# Altium project 24V-10A-Power-Board-v1.0.PrjPcb (part 13 of 17)
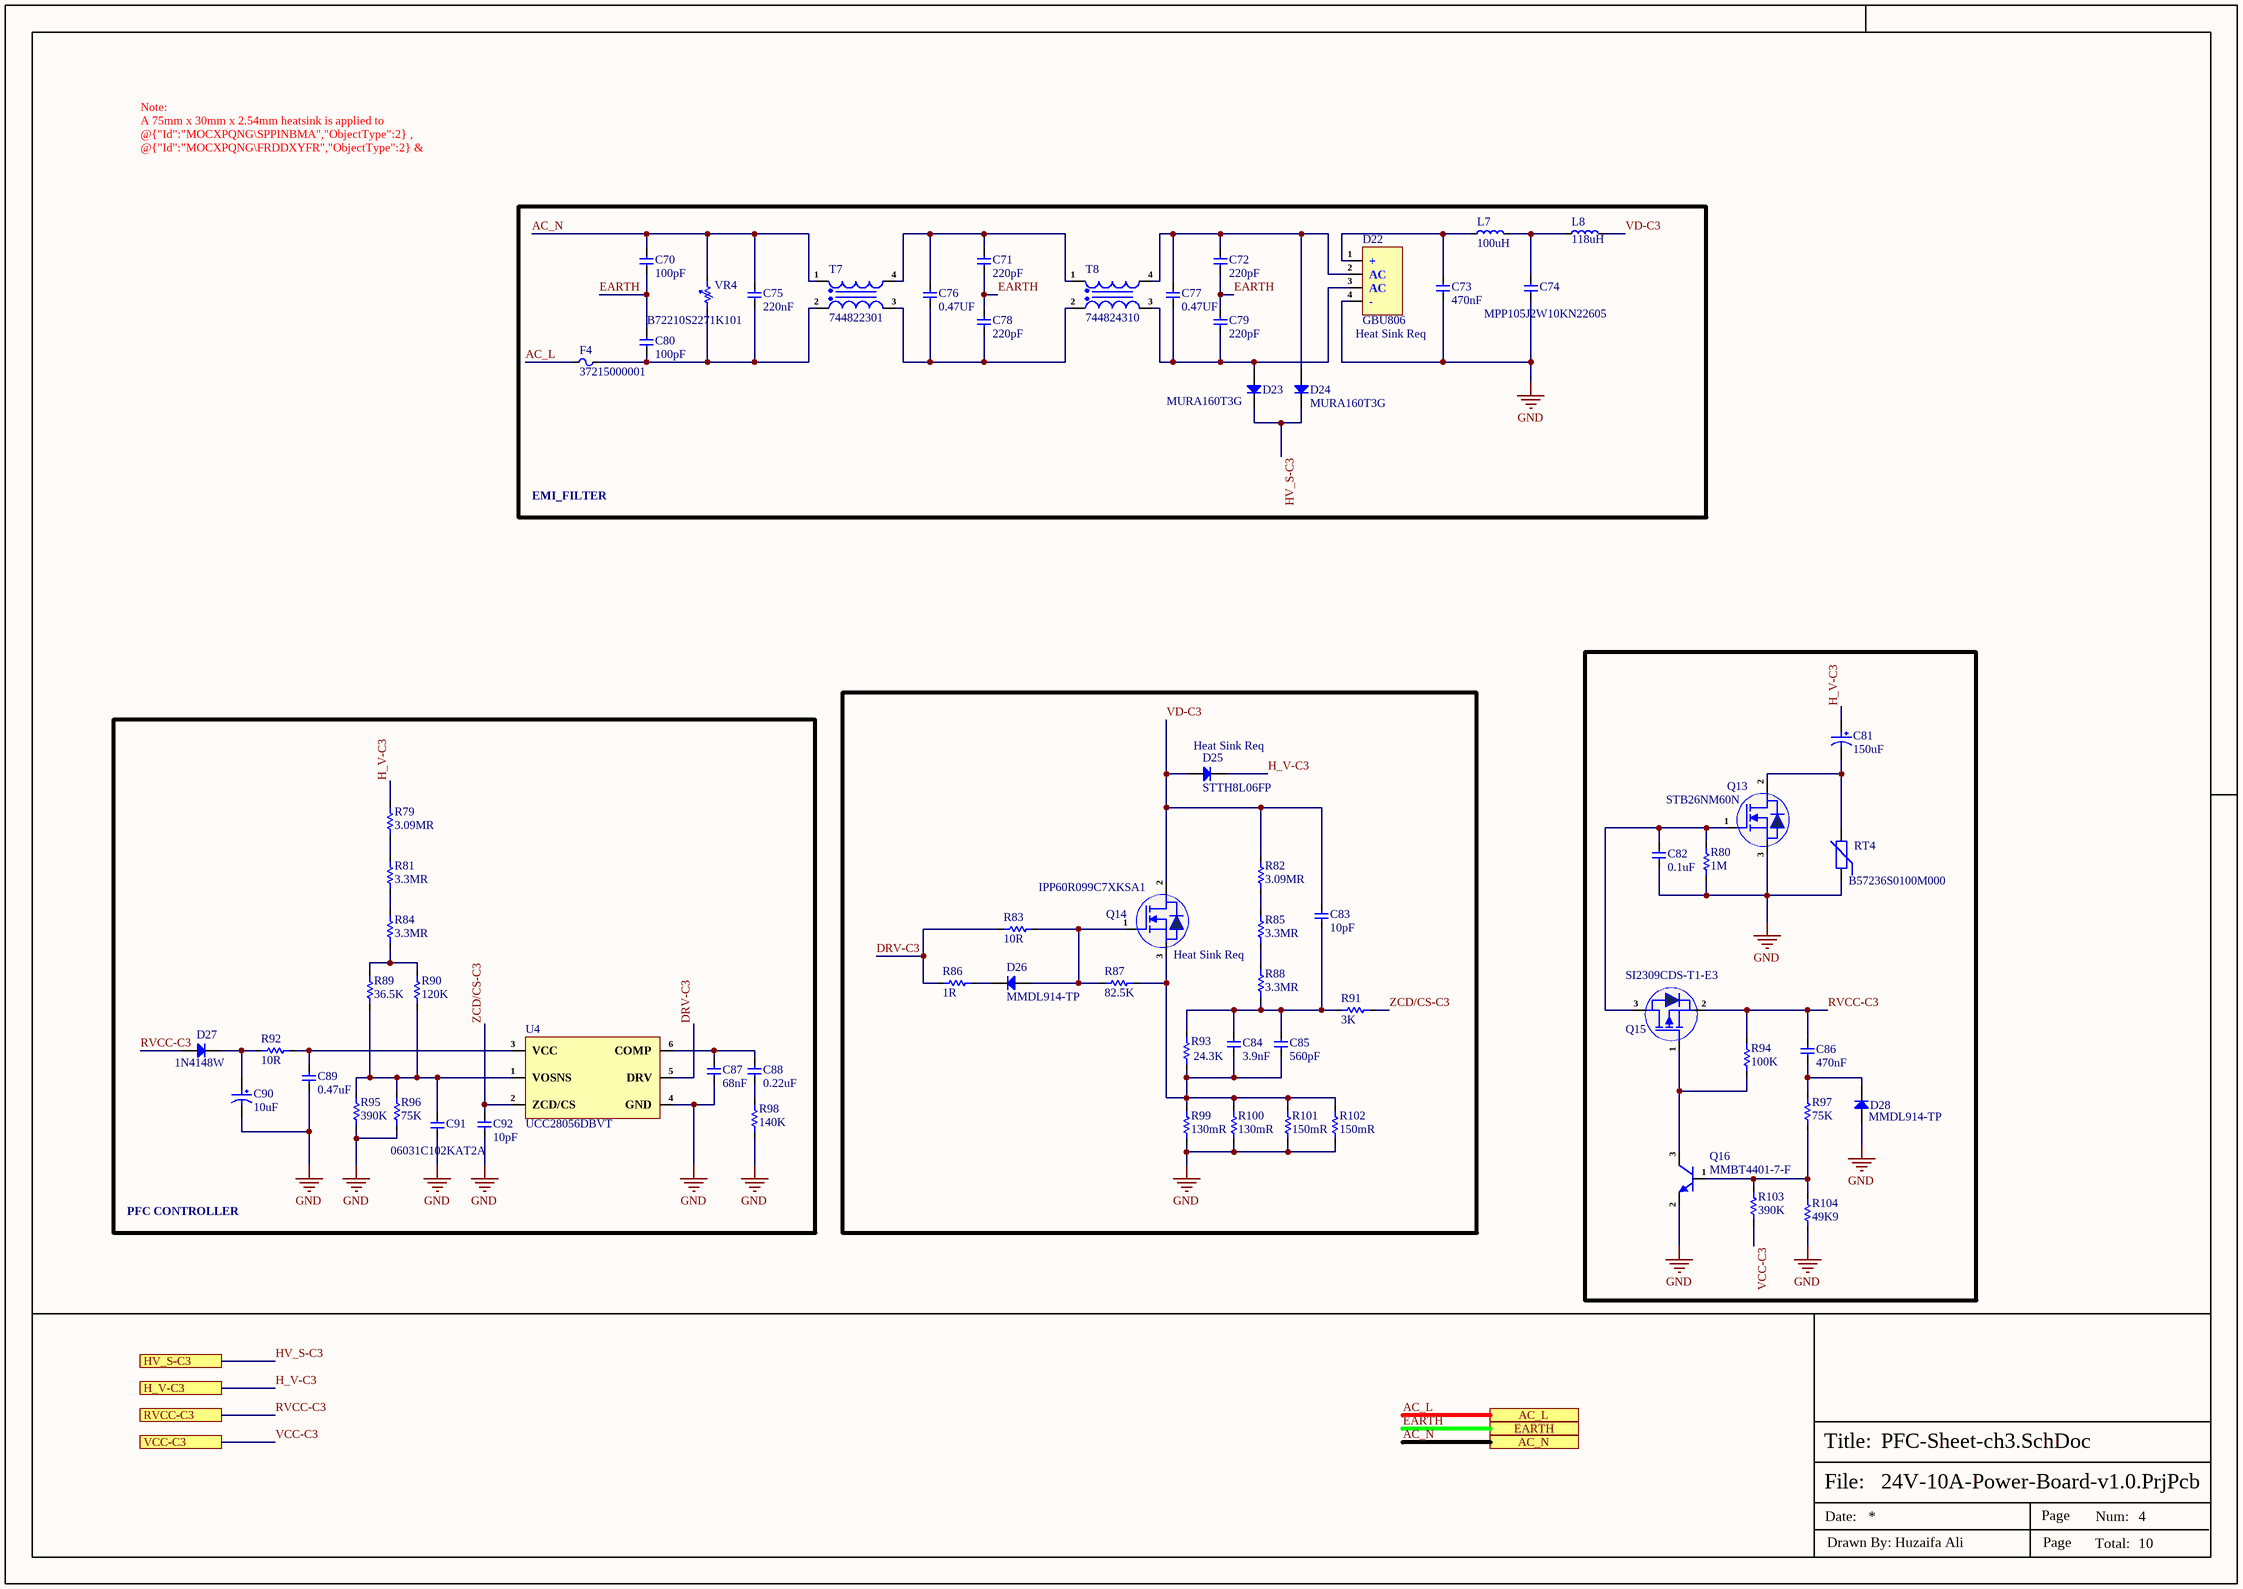
[diagram p21: PFC-Sheet-ch3.SchDoc]

## Sheet PFC-Sheet-ch3.SchDoc (continued)

### Library data of the parts (continued)
R91 = RC0603FR-073KL: RES 3K OHM 1% 1/10W 0603; Manufacturer: Yageo; Item Type: Resistor; Value: 3kR; Power Rating: 100mW; Voltage Rating: 50V; Temperature Coefficient: 100ppm/°C; Supplier: Avnet; LCSC Part Number: C126358; Manufacturer Part Number: RC0603FR-073KL; RoHS: Yes; Case/Package: 0603; Pins: 2NUMBER; Case Code (Imperial): 0603; Case Code (Metric): 1608; Min Operating Temperature: -55°C; Max Operating Temperature: 155°C; Tolerance: 1%; Packaging: Tape and Reel; Termination: SMD/SMT; Resistor Type: Thick Film; Features: Moisture Resistant; Series: RC; Max Power Dissipation: 100mW; Number of Terminations: 2; Construction: Rectangular; Resistance Tolerance: 1%; Voltage Rating (DC): 50V; Length: 1.6mm; Width: 800um; Depth: 0.8mm; Reach SVHC Compliant: No; Military Standard: Not; RoHS Compliant: Yes; Lead Free: 5697LeadFree; ComponentLink1URL: http://www.farnell.com/datasheets/2167052.pdf?src-supplier=Farnell; ComponentLink1Description: http://www.farnell.com/datasheets/2167052.pdf?src-supplier=Farnell; ComponentLink2URL: http://www.mouser.com/ds/2/447/RC0603-272842.pdf?src-supplier=Mouser; ComponentLink2Description: http://www.mouser.com/ds/2/447/RC0603-272842.pdf?src-supplier=Mouser; ComponentLink3URL: https://www.verical.com/server-webapp/html/getDatasheet?partID=135099&src-supplier=Verical; ComponentLink3Description: https://www.verical.com/server-webapp/html/getDatasheet?partID=135099&src-supplier=Verical; ComponentLink4URL: http://www.farnell.com/datasheets/2167052.pdf?src-supplier=Element14; ComponentLink4Description: http://www.farnell.com/datasheets/2167052.pdf?src-supplier=Element14; ComponentLink5URL: http://www.yageo.com/documents/recent/PYu-RC_Group_51_RoHS_L_10.pdf?src-supplier=Digikey; ComponentLink5Description: http://www.yageo.com/documents/recent/PYu-RC_Group_51_RoHS_L_10.pdf?src-supplier=Digikey; ComponentLink6URL: http://www.yageo.com/documents/recent/PYu-RC_Group_51_RoHS_L_9.pdf?src-supplier=Digikey; ComponentLink6Description: http://www.yageo.com/documents/recent/PYu-RC_Group_51_RoHS_L_9.pdf?src-supplier=Digikey; ComponentLink7URL: https://datasheet.octopart.com/RC0603FR-073KL-Yageo-datasheet-8328172.pdf?src-supplier=Farnell; ComponentLink7Description: https://datasheet.octopart.com/RC0603FR-073KL-Yageo-datasheet-8328172.pdf?src-supplier=Farnell; ComponentLink8URL: http://www.yageo.com/documents/recent/PYu-RC0603_51_RoHS_L_7.pdf?src-supplier=Future+Electronics; ComponentLink8Description: http://www.yageo.com/documents/recent/PYu-RC0603_51_RoHS_L_7.pdf?src-supplier=Future+Electronics; ComponentLink9URL: https://datasheet.octopart.com/RC0603FR-073KL-Yageo-datasheet-34211833.pdf?src-supplier=Element14; ComponentLink9Description: https://datasheet.octopart.com/RC0603FR-073KL-Yageo-datasheet-34211833.pdf?src-supplier=Element14; ComponentLink10URL: http://www.farnell.com/datasheets/1868787.pdf?src-supplier=Newark; ComponentLink10Description: http://www.farnell.com/datasheets/1868787.pdf?src-supplier=Newark; ComponentLink11URL: https://datasheet.octopart.com/RC0603FR-073KL-Yageo-datasheet-164759695.pdf?src-supplier=Future+Electronics; ComponentLink11Description: https://datasheet.octopart.com/RC0603FR-073KL-Yageo-datasheet-164759695.pdf?src-supplier=Future+Electronics
R92 = CRCW080510R0FKEAHP: RES SMD 10 OHM 1% 1/2W 0805; Manufacturer: Vishay; Item Type: Resistor; Power Rating: 330mW; Voltage Rating: 150V; Temperature Coefficient: 100ppm/°C; Max Power Dissipation: 333mW; Supplier: Mouser; LCSC Part Number: C844598; Manufacturer Part Number: CRCW080510R0FKEAHP; RoHS: Yes; Stock: 384044; Pricing: 1=0.19, 10=0.066, 50=0.066, 100=0.04, 1000=0.027, 10000=0.023 (USD); Case/Package: 0805; Weight: 0.000194oz; Case Code (Imperial): 0805; Case Code (Metric): 2012; Contact Plating: Tin; Min Operating Temperature: -55°C; Max Operating Temperature: 155°C; Value: 10R; Tolerance: 1%; Packaging: Tape and Reel; Package Quantity: 5000; Resistor Type: Thick Film; Termination: SMD/SMT; Voltage Rating (DC): 150V; Features: Automotive AEC-Q200; Series: CRCW-HP; Number of Terminations: 2; Resistance Tolerance: 1%; Technology: THICK FILM; Construction: Rectangular; Length: 2mm; Width: 1.2mm; Height: 0.5mm; Depth: 1.25mm; Ratings: AEC-Q200; Radiation Hardening: No; Military Standard: Not; Lead Free: Lead Free; RoHS Compliant: Yes; Reach SVHC Compliant: Unknown; ComponentLink1URL: http://www.farnell.com/datasheets/2884039.pdf?src-supplier=Newark; ComponentLink1Description: http://www.farnell.com/datasheets/2884039.pdf?src-supplier=Newark; ComponentLink2URL: https://datasheet.octopart.com/CRCW080510R0FKEAHP-Vishay-datasheet-87136057.pdf?src-supplier=Newark; ComponentLink2Description: https://datasheet.octopart.com/CRCW080510R0FKEAHP-Vishay-datasheet-87136057.pdf?src-supplier=Newark; ComponentLink3URL: http://www.vishay.com/docs/20043/crcwhpe3.pdf?src-supplier=Digikey; ComponentLink3Description: http://www.vishay.com/docs/20043/crcwhpe3.pdf?src-supplier=Digikey
R93 = RC0603FR-0724K3L: RES 24.3K OHM 1% 1/10W 0603; Manufacturer: Yageo; Item Type: Resistors; Voltage Rating (DC): 50V; Supplier: Future Electronics; Supplier Part Number: 6938161; Manufacturer Part Number: RC0603FR-0724K3L; RoHS: Yes; Stock: 440000; Pricing: 5000=0.0015, 50000=0.0014, 150000=0.0014, 375000=0.0013, 1000000=0.0012 (USD); Lead Free: 5697LeadFree; ComponentLink1URL: https://datasheet.ciiva.com/15189/getdatasheetpartid-326710-15189669.pdf?src-supplier=Verical; ComponentLink1Description: https://datasheet.ciiva.com/15189/getdatasheetpartid-326710-15189669.pdf?src-supplier=Verical
R94 = CRCW0603100KFKEA: RES SMD 100K OHM 1% 1/10W 0603; Item Type: Resistor; Value: 100kR; Temperature Coefficient: 100ppm/°C; Voltage Rating: 75V; Power Rating: 100mW; ComponentLink1Description: LCSC; Supplier: Mouser; Supplier Part Number: 71-CRCW0603-100K-E3; RoHS: Yes; Category: Chip SMD Resistors; Stock: 716604; Pricing: 1=0.1, 10=0.019, 50=0.019, 100=0.009, 1000=0.007, 10000=0.004 (USD); Case/Package: 345Case; Pins: 2NUMBER; Case Code (Imperial): 0603; Case Code (Metric): 1608; Min Operating Temperature: -55°C; Max Operating Temperature: 155°C; Tolerance: 1%; Resistor Type: Thick Film; Resistance Tolerance: 1%; Packaging: 13Packaging; Voltage Rating (DC): 75V; Features: 6309FeaturesType; Height: 500um; RoHS Compliant: Yes; Lead Free: 5697LeadFree; ComponentLink2URL: http://www.farnell.com/datasheets/2310790.pdf?src-supplier=Farnell; ComponentLink2Description: http://www.farnell.com/datasheets/2310790.pdf?src-supplier=Farnell; ComponentLink3URL: https://datasheet.octopart.com/CRCW0603100KFKEA-Vishay-datasheet-14722531.pdf?src-supplier=Newark; ComponentLink3Description: https://datasheet.octopart.com/CRCW0603100KFKEA-Vishay-datasheet-14722531.pdf?src-supplier=Newark; ComponentLink4URL: https://www.vishay.com/docs/20035/dcrcwe3.pdf?src-supplier=Digi-Key; ComponentLink4Description: https://www.vishay.com/docs/20035/dcrcwe3.pdf?src-supplier=Digi-Key; ComponentLink5URL: https://datasheet.octopart.com/CRCW0603100KFKEA-Vishay-datasheet-5300368.pdf?src-supplier=Future+Electronics; ComponentLink5Description: https://datasheet.octopart.com/CRCW0603100KFKEA-Vishay-datasheet-5300368.pdf?src-supplier=Future+Electronics; ComponentLink6URL: http://www.farnell.com/datasheets/2310790.pdf?src-supplier=Newark; ComponentLink6Description: http://www.farnell.com/datasheets/2310790.pdf?src-supplier=Newark; ComponentLink7URL: http://www.farnell.com/datasheets/2310790.pdf?src-supplier=Element14; ComponentLink7Description: http://www.farnell.com/datasheets/2310790.pdf?src-supplier=Element14; ComponentLink8URL: https://datasheet.octopart.com/CRCW0603100KFKEA-Vishay-datasheet-83961561.pdf?src-supplier=Element14; ComponentLink8Description: https://datasheet.octopart.com/CRCW0603100KFKEA-Vishay-datasheet-83961561.pdf?src-supplier=Element14; ComponentLink9URL: https://datasheet.octopart.com/CRCW0603100KFKEA-Vishay-datasheet-8363642.pdf?src-supplier=Verical; ComponentLink9Description: https://datasheet.octopart.com/CRCW0603100KFKEA-Vishay-datasheet-8363642.pdf?src-supplier=Verical; ComponentLink10URL: https://datasheet.octopart.com/CRCW0603100KFKEA-Vishay-datasheet-508714.pdf?src-supplier=Farnell; ComponentLink10Description: https://datasheet.octopart.com/CRCW0603100KFKEA-Vishay-datasheet-508714.pdf?src-supplier=Farnell; ComponentLink11URL: https://datasheet.octopart.com/CRCW0603100KFKEA-Vishay-datasheet-17834126.pdf?src-supplier=TME; ComponentLink11Description: https://datasheet.octopart.com/CRCW0603100KFKEA-Vishay-datasheet-17834126.pdf?src-supplier=TME; LCSC Part Number: C844916
R95 R103 = RC0603FR-07390KL: RES 390K OHM 1% 1/10W 0603; Manufacturer: Yageo; Item Type: Resistor; Value: 390kR; Power Rating: 100mW; Voltage Rating: 50V; Temperature Coefficient: 100ppm/°C; Working Voltage: 75V; Supplier: Avnet; LCSC Part Number: C137735; Manufacturer Part Number: RC0603FR-07390KL; RoHS: Yes; Stock: 3700; Pricing: 1=0.104, 25=0.011, 50=0.009, 100=0.006 (USD); Case/Package: 0603; Pins: 2; Case Code (Imperial): 0603; Case Code (Metric): 1608; Min Operating Temperature: -55°C; Max Operating Temperature: 155°C; Tolerance: 1%; Packaging: Tape and Reel; Voltage Rating (DC): 50V; Termination: SMD/SMT; Resistor Type: Thick Film; Number of Terminations: 2; Max Power Dissipation: 100mW; Features: Moisture Resistant; Series: RC; Resistance Tolerance: 1%; Construction: Rectangular; Technology: THICK FILM; Voltage Rating (AC): 50V; Length: 1.6mm; Width: 0.8mm; Height: 0.45mm; Depth: 0.8mm; Military Standard: Not; RoHS Compliant: Yes; Reach SVHC Compliant: Unknown; Lead Free: 5697LeadFree; ComponentLink1URL: https://datasheet.ciiva.com/11819/0900766b80f96399-11819357.pdf?src-supplier=Rs; ComponentLink1Description: https://datasheet.ciiva.com/11819/0900766b80f96399-11819357.pdf?src-supplier=Rs; ComponentLink2URL: https://datasheet.ciiva.com/5557/rc0603-5557952.pdf?src-supplier=Mouser; ComponentLink2Description: https://datasheet.ciiva.com/5557/rc0603-5557952.pdf?src-supplier=Mouser; ComponentLink3URL: https://datasheet.ciiva.com/2454/pyu-r-int-thick-7-2454247.pdf?src-supplier=Digikey; ComponentLink3Description: https://datasheet.ciiva.com/2454/pyu-r-int-thick-7-2454247.pdf?src-supplier=Digikey; ComponentLink4URL: https://datasheet.ciiva.com/2454/pyu-r-int-thick-7-2454248.pdf?src-supplier=Digikey; ComponentLink4Description: https://datasheet.ciiva.com/2454/pyu-r-int-thick-7-2454248.pdf?src-supplier=Digikey; ComponentLink5URL: https://datasheet.ciiva.com/2454/pyu-r-int-thick-7-2454246.pdf?src-supplier=Digikey; ComponentLink5Description: https://datasheet.ciiva.com/2454/pyu-r-int-thick-7-2454246.pdf?src-supplier=Digikey
R96 R97 = RC0603FR-0775KL: RES 75K OHM 1% 1/10W 0603; Manufacturer: Yageo; Item Type: Resistor; Value: 75kR; Power Rating: 100mW; Voltage Rating: 50V; Temperature Coefficient: 100ppm/°C; Supplier: Future Electronics; LCSC Part Number: C114636; Manufacturer Part Number: RC0603FR-0775KL; RoHS: Yes; Stock: 550000; Pricing: 5000=0.0015, 75000=0.0015, 250000=0.0014, 750000=0.0013, 2500000=0.0012 (USD); Case/Package: 0603; Pins: 2NUMBER; Case Code (Imperial): 0603; Case Code (Metric): 1608; Min Operating Temperature: -55°C; Max Operating Temperature: 155°C; Tolerance: 1%; Packaging: Tape and Reel; Termination: SMD/SMT; Resistor Type: Thick Film; Number of Terminations: 2; Max Power Dissipation: 100mW; Features: Moisture Resistant; Series: RC; Technology: THICK FILM; Resistance Tolerance: 1%; Construction: Rectangular; Voltage Rating (DC): 50V; Length: 1.6mm; Height: 0.45mm; Depth: 0.8mm; RoHS Compliant: Yes; Reach SVHC Compliant: No; Military Standard: Not; Lead Free: 5697LeadFree; ComponentLink1URL: https://datasheet.ciiva.com/11808/0900766b80f96399-11808100.pdf?src-supplier=Rs; ComponentLink1Description: https://datasheet.ciiva.com/11808/0900766b80f96399-11808100.pdf?src-supplier=Rs; ComponentLink2URL: https://datasheet.ciiva.com/15189/getdatasheetpartid-326733-15189816.pdf?src-supplier=Verical; ComponentLink2Description: https://datasheet.ciiva.com/15189/getdatasheetpartid-326733-15189816.pdf?src-supplier=Verical; ComponentLink3URL: https://datasheet.ciiva.com/2455/pyu-r-int-thick-7-2455324.pdf?src-supplier=Digikey; ComponentLink3Description: https://datasheet.ciiva.com/2455/pyu-r-int-thick-7-2455324.pdf?src-supplier=Digikey; ComponentLink4URL: https://datasheet.ciiva.com/2455/pyu-r-int-thick-7-2455325.pdf?src-supplier=Digikey; ComponentLink4Description: https://datasheet.ciiva.com/2455/pyu-r-int-thick-7-2455325.pdf?src-supplier=Digikey; ComponentLink5URL: https://datasheet.ciiva.com/2455/pyu-r-int-thick-7-2455323.pdf?src-supplier=Digikey; ComponentLink5Description: https://datasheet.ciiva.com/2455/pyu-r-int-thick-7-2455323.pdf?src-supplier=Digikey; ComponentLink6URL: https://datasheet.ciiva.com/46395/443971-46395017.pdf?src-supplier=Element14; ComponentLink6Description: https://datasheet.ciiva.com/46395/443971-46395017.pdf?src-supplier=Element14
R98 = RC0603FR-07140KL: RES 140K OHM 1% 1/10W 0603; Manufacturer: Yageo; Item Type: Resistor; Voltage Rating (DC): 50V; Supplier: Future Electronics; LCSC Part Number: C185372; Manufacturer Part Number: RC0603FR-07140KL; RoHS: Yes; Stock: 215000; Pricing: 5000=0.0015, 50000=0.0014, 150000=0.0014, 375000=0.0013, 1000000=0.0012 (USD); Lead Free: 5697LeadFree; ComponentLink1URL: https://datasheet.ciiva.com/2453/pyu-r-int-thick-7-2453916.pdf?src-supplier=Digikey; ComponentLink1Description: https://datasheet.ciiva.com/2453/pyu-r-int-thick-7-2453916.pdf?src-supplier=Digikey; ComponentLink2URL: https://datasheet.ciiva.com/2453/pyu-r-int-thick-7-2453917.pdf?src-supplier=Digikey; ComponentLink2Description: https://datasheet.ciiva.com/2453/pyu-r-int-thick-7-2453917.pdf?src-supplier=Digikey; ComponentLink3URL: https://datasheet.ciiva.com/2453/pyu-r-int-thick-7-2453918.pdf?src-supplier=Digikey; ComponentLink3Description: https://datasheet.ciiva.com/2453/pyu-r-int-thick-7-2453918.pdf?src-supplier=Digikey
R99 R100 = CSR1206FTR130: 500mW Thick Film Resistors ±100ppm/℃ ±1% 130mΩ 1206 Chip Resistor - Surface Mount ROHS; Manufacturer: SEI(Stackpole Elec); Manufacturer Part Number: CSR1206FTR130; Package: 1206; LCSC Part Number: C346779; Item Type: Resistor; ComponentLink1Description: LCSC; ComponentLink1URL: https://www.lcsc.com/product-detail/Chip-Resistor-Surface-Mount_SEI-Stackpole-Elec-CSR1206FTR130_C346779.html
R101 R102 = RL1206FR-7W0R15L: RES 0.15 OHM 1% 1/2W 1206; Manufacturer: YAGEO; Item Type: Resistor; Manufacturer Part Number: RL1206FR-7W0R15L; Package: 1206; LCSC Part Number: C859925; ComponentLink1Description: LCSC; ComponentLink1URL: https://www.lcsc.com/product-detail/Chip-Resistor-Surface-Mount_YAGEO-RL1206FR-7W0R15L_C859925.html
R104 = RC0603FR-0749K9L: RES 49.9K OHM 1% 1/10W 0603; Manufacturer: Yageo; Power Rating: 100mW; Resistance: 49.9kR; Temperature Coefficient: 100ppm/°C; Voltage Rating (DC): 50V; Item Type: Resistor; Supplier 1: Digi-Key; Manufacturer Part Number: RC0603FR-0749K9L; RoHS: Yes; Category: Chip SMD Resistors; Stock 1: 77863; Pricing 1: 1=0.10000, 10=0.02400, 100=0.00970, 1000=0.00436, 2500=0.00378 (USD); Mount: Surface Mount; Case/Package: 0603; Case Code (Metric): 1608; Case Code (Imperial): 0603; Size Code: 0603; Min Operating Temperature: -55°C; Max Operating Temperature: 155°C; Tolerance: 1%; Packaging: Tape and Reel; Package Quantity: 1; Voltage Rating: 50V; Resistor Type: Thick Film; Number of Terminations: 2; Termination: SMD/SMT; Max Power Dissipation: 100mW; Features: Moisture Resistant; Series: RC; Construction: Rectangular; Length: 0.063inch; Width: 0.031inch; Height: 0.022inch; Depth: 0.8mm; Lead Free: Lead Free; Military Standard: Not; RoHS Compliant: Yes; ComponentLink1URL: https://datasheet.ciiva.com/2454/pyu-r-int-thick-7-2454042.pdf?src-supplier=Digi-Key; ComponentLink1Description: https://datasheet.ciiva.com/2454/pyu-r-int-thick-7-2454042.pdf?src-supplier=Digi-Key; ComponentLink2URL: https://datasheet.ciiva.com/2454/pyu-r-int-thick-7-2454043.pdf?src-supplier=Digi-Key; ComponentLink2Description: https://datasheet.ciiva.com/2454/pyu-r-int-thick-7-2454043.pdf?src-supplier=Digi-Key; ComponentLink3URL: https://datasheet.ciiva.com/2454/pyu-r-int-thick-7-2454044.pdf?src-supplier=Digi-Key; ComponentLink3Description: https://datasheet.ciiva.com/2454/pyu-r-int-thick-7-2454044.pdf?src-supplier=Digi-Key; ComponentLink4URL: https://datasheet.ciiva.com/15189/getdatasheetpartid-323805-15189749.pdf?src-supplier=Verical; ComponentLink4Description: https://datasheet.ciiva.com/15189/getdatasheetpartid-323805-15189749.pdf?src-supplier=Verical; Supplier Part Number 1: 311-49.9KHRCT-ND; LCSC Part Number: C114624
RT4 = B57236S0100M000: ICL 10 OHM 20% 3.5A 11.5MM; Manufacturer: TDK EPCOS; Item Type: Thermistors; Supplier: Mouser; LCSC Part Number: C125458; Manufacturer Part Number: B57236S0100M000; RoHS: Yes; Stock: 2235; Pricing: 1=0.84, 10=0.78, 50=0.646, 100=0.572, 1000=0.44, 10000=0.373 (USD); Current Rating: 3.5A; Tolerance: 20%; Diameter: 11.5mm; Thickness: 6mm; Lead Free: 5697LeadFree; ComponentLink1URL: https://datasheet.ciiva.com/15097/getdatasheetpartid-119550-15097692.pdf?src-supplier=Verical; ComponentLink1Description: https://datasheet.ciiva.com/15097/getdatasheetpartid-119550-15097692.pdf?src-supplier=Verical; ComponentLink2URL: https://datasheet.ciiva.com/1321/1851770-1321676.pdf?src-supplier=Element14; ComponentLink2Description: https://datasheet.ciiva.com/1321/1851770-1321676.pdf?src-supplier=Element14
T7 = 744822301: CMC 1MH 3A 2LN TH; Manufacturer: Wurth Electronics; Item Type: Inductor; Supplier: Digikey; Supplier Part Number: 732-1439-ND; Manufacturer Part Number: 744822301; RoHS: Yes; Stock: 1589; Pricing: 1=4.57, 10=4.5, 50=3.57, 140=3.41, 280=3.1 (USD); ComponentLink1URL: https://datasheet.ciiva.com/4952/744822301-91864-4952415.pdf?src-supplier=Mouser; ComponentLink1Description: https://datasheet.ciiva.com/4952/744822301-91864-4952415.pdf?src-supplier=Mouser; ComponentLink2URL: https://datasheet.ciiva.com/11796/0900766b804ac271-11796688.pdf?src-supplier=Rs; ComponentLink2Description: https://datasheet.ciiva.com/11796/0900766b804ac271-11796688.pdf?src-supplier=Rs; ComponentLink3URL: https://datasheet.ciiva.com/7211/70388-7211253.pdf?src-supplier=Newark; ComponentLink3Description: https://datasheet.ciiva.com/7211/70388-7211253.pdf?src-supplier=Newark; ComponentLink4URL: https://datasheet.ciiva.com/7754/1736520-7754735.pdf?src-supplier=Element14; ComponentLink4Description: https://datasheet.ciiva.com/7754/1736520-7754735.pdf?src-supplier=Element14; ComponentLink5URL: https://datasheet.ciiva.com/6216/744822301-6216281.pdf?src-supplier=Digikey; ComponentLink5Description: https://datasheet.ciiva.com/6216/744822301-6216281.pdf?src-supplier=Digikey
T8 = 744824310: CMC 10MH 3A 2LN TH; Manufacturer: Wurth Electronics; Item Type: Common Mode Chokes; Tolerance: 30%; Test Frequency: 10kHz; Number of Lines: 2; DC Resistance (DCR): 105mR; Supplier: Digikey; Supplier Part Number: 732-1452-ND; Manufacturer Part Number: 744824310; RoHS: Yes; Stock: 278; Pricing: 1=5.63, 10=5.54, 100=4.39, 250=4.2, 500=3.82 (USD); Mounting Technology: Through Hole,Radial; Case/Package: L; Pins: 4; Min Operating Temperature: -40°C; Max Operating Temperature: 125°C; Current Rating: 3A; Packaging: Bulk; Value: 10mH; Max DC Current: 3A; Termination: Radial; Series: WE-CMB; Inductance Tolerance: 30%; Package Quantity: 200; Current: 3A; Length: 27.5mm; Width: 18.5mm; Height: 33mm; Lead Pitch: 10mm; Depth: 18.5mm; Reach SVHC Compliant: No; RoHS Compliant: Yes; Lead Free: Lead Free; ComponentLink1URL: https://datasheet.ciiva.com/11796/0900766b804acf58-11796710.pdf?src-supplier=Rs; ComponentLink1Description: https://datasheet.ciiva.com/11796/0900766b804acf58-11796710.pdf?src-supplier=Rs; ComponentLink2URL: https://datasheet.ciiva.com/4952/744824310-39306-4952431.pdf?src-supplier=Mouser; ComponentLink2Description: https://datasheet.ciiva.com/4952/744824310-39306-4952431.pdf?src-supplier=Mouser; ComponentLink3URL: https://datasheet.ciiva.com/6214/744824310-6214810.pdf?src-supplier=Digikey; ComponentLink3Description: https://datasheet.ciiva.com/6214/744824310-6214810.pdf?src-supplier=Digikey; ComponentLink4URL: https://datasheet.ciiva.com/7211/70411-7211262.pdf?src-supplier=Newark; ComponentLink4Description: https://datasheet.ciiva.com/7211/70411-7211262.pdf?src-supplier=Newark; ComponentLink5URL: https://datasheet.ciiva.com/7754/1736534-7754741.pdf?src-supplier=Element14; ComponentLink5Description: https://datasheet.ciiva.com/7754/1736534-7754741.pdf?src-supplier=Element14; ComponentLink6URL: https://datasheet.ciiva.com/48690/001088035-da-01-ml-we-cmb-stromkomp-netzdrossel-74482-de-en-48690603.pdf?src-supplier=Conrad; ComponentLink6Description: https://datasheet.ciiva.com/48690/001088035-da-01-ml-we-cmb-stromkomp-netzdrossel-74482-de-en-48690603.pdf?src-supplier=Conrad
U4 = UCC28056DBVT: IC PFC CTRLR TRANSITION SOT23-6; Manufacturer: Texas Instruments; Manufacturer Part Number: UCC28056DBVT; Package: SOT-23-6; LCSC Part Number: C2868631; Item Type: IC; ComponentLink1Description: LCSC; ComponentLink1URL: https://www.lcsc.com/product-detail/AC-DC-Controllers-Regulators_Texas-Instruments-UCC28056DBVT_C2868631.html
VR4 = B72210S2271K101: VARISTOR 430V 3.5KA DISC 10MM; Manufacturer: TDK EPCOS; Item Type: Varistors; Value: 195pF; Number of Circuits: 1; Max Voltage Rating (AC): 275V; Max Voltage Rating (DC): 350V; Energy: 55J; Min Varistor Voltage: 387V; Max Varistor Voltage: 473V; Clamping Current: 25A; Clamping Voltage: 710V; Lead/Base Style: Radial; Voltage Tolerance: 10%; Power Rating: 400mW; ESD Protection: 5898YesNo; Supplier: Avnet; LCSC Part Number: C210564; Manufacturer Part Number: B72210S2271K101; RoHS: Yes; Stock: 5700; Pricing: 1=0.12365, 10=0.12192, 30=0.12018, 50=0.11845, 100=0.11671 (USD); Mounting Technology: Through Hole; Case/Package: Radial; Contact Plating: 154ConductorMaterial; Weight: 2.000002g; Material: 4240ConductorMaterial; Min Operating Temperature: -40°C; Max Operating Temperature: 85°C; Packaging: Bulk; Varistor Voltage: 430V; Max Surge Current: 3.5kA; Series: AdvanceD; Voltage Rating: 350V; Voltage Rating (AC): 275V; Voltage Rating (DC): 350V; Termination: 4745ConnectorType; Tolerance: 10%; Current Rating: 25A; Diameter: 12mm; Height: 14.5mm; Lead Pitch: 7.5mm; Depth: 5.4mm; Radiation Hardening: 5898YesNo; RoHS Compliant: Yes; Reach SVHC Compliant: Unknown; Flammability Rating: 5813Flammability; ComponentLink1URL: http://www.farnell.com/datasheets/1680955.pdf?src-supplier=Farnell; ComponentLink1Description: http://www.farnell.com/datasheets/1680955.pdf?src-supplier=Farnell; ComponentLink2URL: http://www.farnell.com/datasheets/2311597.pdf?src-supplier=Farnell; ComponentLink2Description: http://www.farnell.com/datasheets/2311597.pdf?src-supplier=Farnell; ComponentLink3URL: http://components.arrow.com/part/dataview/30869957S9461734N9769?src-supplier=Arrow+Electronics; ComponentLink3Description: http://components.arrow.com/part/dataview/30869957S9461734N9769?src-supplier=Arrow+Electronics; ComponentLink4URL: http://www.farnell.com/datasheets/1680955.pdf?src-supplier=Element14; ComponentLink4Description: http://www.farnell.com/datasheets/1680955.pdf?src-supplier=Element14; ComponentLink5URL: http://www.farnell.com/datasheets/2311597.pdf?src-supplier=Newark; ComponentLink5Description: http://www.farnell.com/datasheets/2311597.pdf?src-supplier=Newark; ComponentLink6URL: http://datasheet.octopart.com/B72210S2271K101-EPCOS-datasheet-11546246.pdf?src-supplier=Distrelec; ComponentLink6Description: http://datasheet.octopart.com/B72210S2271K101-EPCOS-datasheet-11546246.pdf?src-supplier=Distrelec; ComponentLink7URL: https://en.tdk.eu/inf/70/db/var/SIOV_Leaded_AdvanceD.pdf?src-supplier=Digikey; ComponentLink7Description: https://en.tdk.eu/inf/70/db/var/SIOV_Leaded_AdvanceD.pdf?src-supplier=Digikey; ComponentLink8URL: https://datasheet.octopart.com/S10K275E2-EPCOS-datasheet-5104.pdf?src-supplier=Future+Electronics; ComponentLink8Description: https://datasheet.octopart.com/S10K275E2-EPCOS-datasheet-5104.pdf?src-supplier=Future+Electronics; ComponentLink9URL: http://datasheet.octopart.com/B72210S2271K101-EPCOS-datasheet-11546246.pdf?src-supplier=Mouser; ComponentLink9Description: http://datasheet.octopart.com/B72210S2271K101-EPCOS-datasheet-11546246.pdf?src-supplier=Mouser; ComponentLink10URL: https://datasheet.octopart.com/B72210S2271K101-EPCOS-datasheet-11546246.pdf?src-supplier=Newark; ComponentLink10Description: https://datasheet.octopart.com/B72210S2271K101-EPCOS-datasheet-11546246.pdf?src-supplier=Newark; ComponentLink11URL: http://datasheet.octopart.com/B72210S2271K101-EPCOS-datasheet-11546246.pdf?src-supplier=Avnet; ComponentLink11Description: http://datasheet.octopart.com/B72210S2271K101-EPCOS-datasheet-11546246.pdf?src-supplier=Avnet; ComponentLink12URL: http://www.epcos.com/inf/70/db/var_08/SIOV_Leaded_StandarD.pdf?src-supplier=Future+Electronics; ComponentLink12Description: http://www.epcos.com/inf/70/db/var_08/SIOV_Leaded_StandarD.pdf?src-supplier=Future+Electronics; ComponentLink13URL: http://datasheet.octopart.com/B72210S2271K101-EPCOS-datasheet-11546246.pdf?src-supplier=Verical; ComponentLink13Description: http://datasheet.octopart.com/B72210S2271K101-EPCOS-datasheet-11546246.pdf?src-supplier=Verical; ComponentLink14URL: http://datasheet.octopart.com/B72210S2271K101-EPCOS-datasheet-11546246.pdf?src-supplier=TME; ComponentLink14Description: http://datasheet.octopart.com/B72210S2271K101-EPCOS-datasheet-11546246.pdf?src-supplier=TME; ComponentLink15URL: http://datasheet.octopart.com/B72210S2271K101-EPCOS-datasheet-11546246.pdf?src-supplier=TTI; ComponentLink15Description: http://datasheet.octopart.com/B72210S2271K101-EPCOS-datasheet-11546246.pdf?src-supplier=TTI; ComponentLink16URL: http://datasheet.octopart.com/B72210S2271K101-EPCOS-datasheet-11546246.pdf?src-supplier=Rutronik; ComponentLink16Description: http://datasheet.octopart.com/B72210S2271K101-EPCOS-datasheet-11546246.pdf?src-supplier=Rutronik

## Sheet Power_Controller-Sheet-ch4.SchDoc
size 420 x 297 mm; SheetNumber: 9; SheetTotal: 10
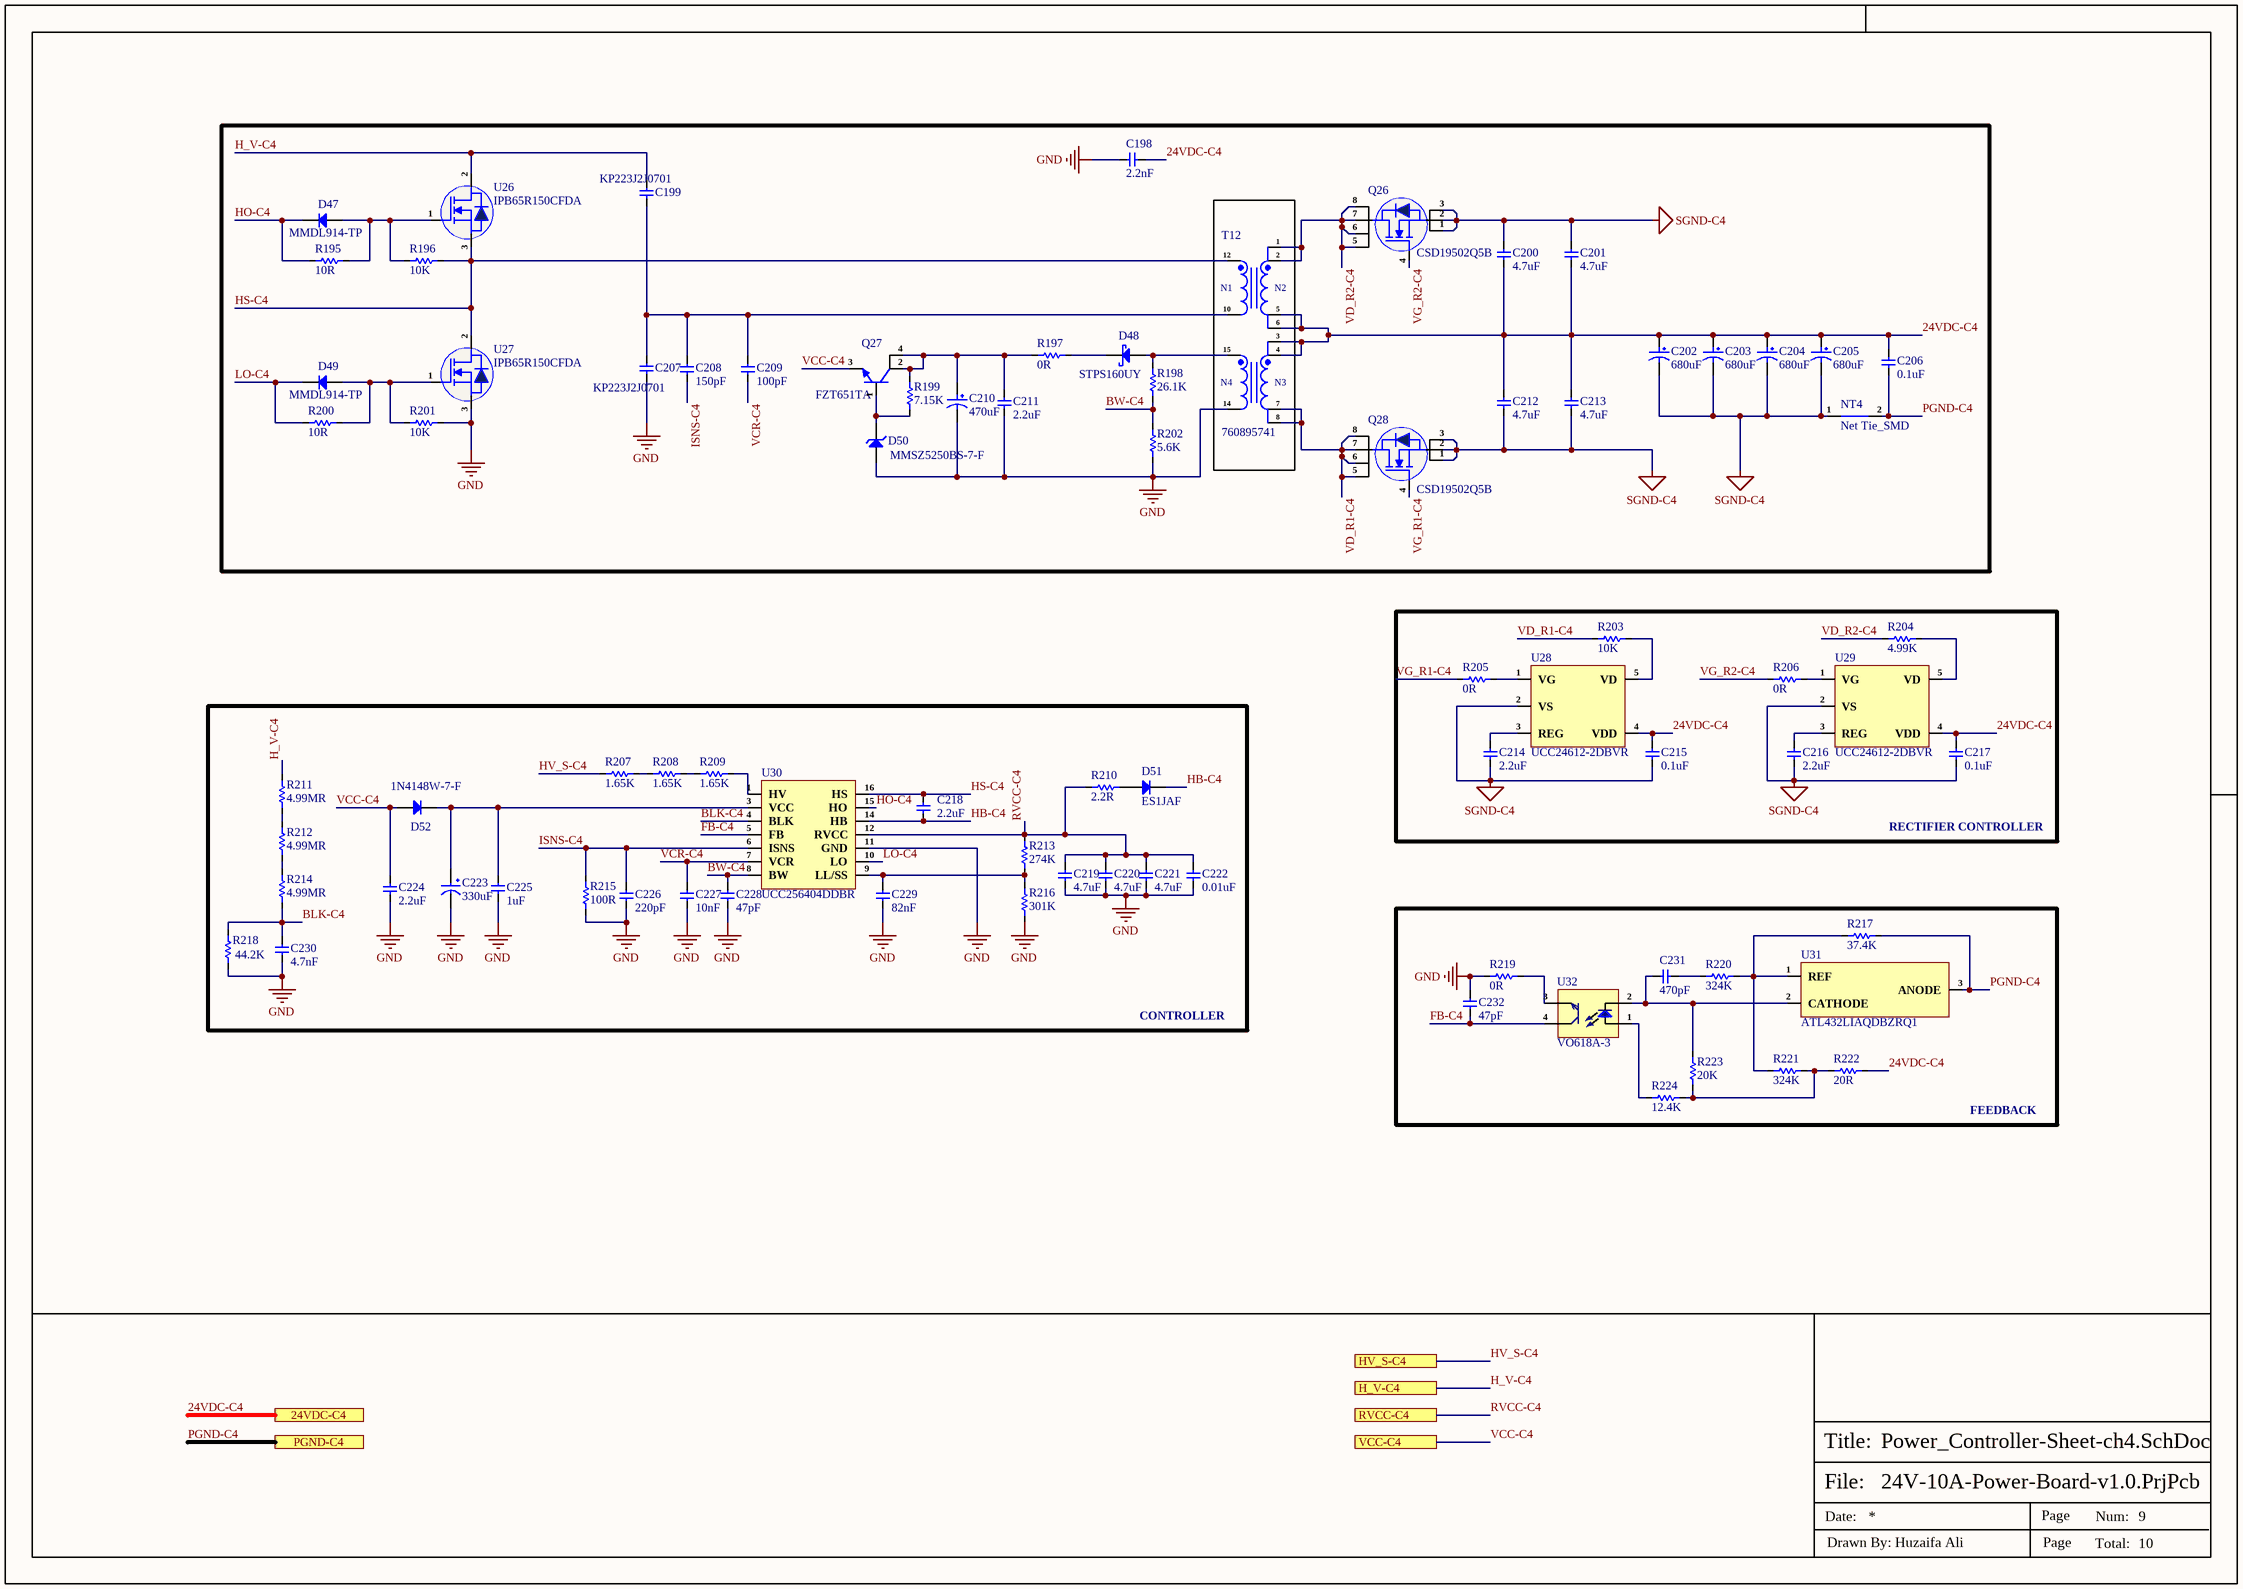
[diagram p8: Power_Controller-Sheet-ch4.SchDoc]

### Parts
C198  2.2nF  [DE1E3RA222MA4BN01F]
C199  KP223J2J0701  [KP223J2J0701]
C200  4.7uF  [Cap-1206]
C201  4.7uF  [Cap-1206]
C202  680uF  [EEU-FR1V681B]
C203  680uF  [EEU-FR1V681B]
C204  680uF  [EEU-FR1V681B]
C205  680uF  [EEU-FR1V681B]
C206  0.1uF  [Cap-1206]
C207  KP223J2J0701  [KP223J2J0701]
C208  150pF  [Cap-1206]
C209  100pF  [Cap-1206]
C210  470uF  [EEUFR1V471B]
C211  2.2uF  [Cap-1206]
C212  4.7uF  [Cap-1206]
C213  4.7uF  [Cap-1206]
C214  2.2uF  [CAP-0603]
C215  0.1uF  [Cap-1206]
C216  2.2uF  [CAP-0603]
C217  0.1uF  [Cap-1206]
C218  2.2uF  [Cap-1206]
C219  4.7uF  [Cap-0603]
C220  4.7uF  [Cap-0603]
C221  4.7uF  [Cap-0603]
C222  0.01uF  [Cap-0603]
C223  330uF  [RC035M331LO8*14TH-2A1E]
C224  2.2uF  [Cap-0603]
C225  1uF  [Cap-1206]
C226  220pF  [Cap-0603]
C227  10nF  [Cap-0603]
C228  47pF  [Cap-0402]
C229  82nF  [Cap-0603]
C230  4.7nF  [Cap-0603]
C231  470pF  [Cap-0603]
C232  47pF  [Cap-0603]
D47  MMDL914-TP  [SOD-323]
D48  STPS160UY  [SMB_]
D49  MMDL914-TP  [SOD-323]
D50  MMSZ5250BS-7-F  [SOD-323]
D51  ES1JAF  [DO-214AD (SMAF)]
D52  1N4148W-7-F  [SOD-123]
NT4  Net Tie_SMD  [Net Tie Pad]  (net tie, no BOM)
Q26  CSD19502Q5B  [VSON-CLIP-8(6x5)]
Q27  FZT651TA  [SOT- 223]
Q28  CSD19502Q5B  [VSON-CLIP-8(6x5)]
R195  10R  [Res-0603]
R196  10K  [RES-0805]
R197  0R  [Res-1206]
R198  26.1K  [Res-0603]
R199  7.15K  [Res-0603]
R200  10R  [Res-0603]
R201  10K  [RES-0805]
R202  5.6K  [RES-0805]
R203  10K  [Res-0603]
R204  4.99K  [Res-0603]
R205  0R  [Res-0402]
R206  0R  [Res-0402]
R207  1.65K  [Res-1206]
R208  1.65K  [Res-1206]
R209  1.65K  [Res-1206]
R210  2.2R  [Res-0603]
R211  4.99MR  [Res-1206]
R212  4.99MR  [Res-1206]
R213  274K  [Res-0603]
R214  4.99MR  [Res-1206]
R215  100R  [Res-0603]
R216  301K  [res-0603]
R217  37.4K  [Res-0603]
R218  44.2K  [Res-0603]
R219  0R  [Res-0603]
R220  324K  [Res-0603]
R221  324K  [Res-0603]
R222  20R  [Res-0603]
R223  20K  [Res-1206]
R224  12.4K  [Res-0603]
T12  760895741  [760895741]
U26  IPB65R150CFDA  [TO-263]
U27  IPB65R150CFDA  [TO-263]
U28  UCC24612-2DBVR  [SOT-23-5]
U29  UCC24612-2DBVR  [SOT-23-5]
U30  UCC256404DDBR  [UCC256404DDBR]
U31  ATL432LIAQDBZRQ1  [SOT-23]
U32  VO618A-3  [DIP-4]

### Blocks framed on the sheet
RECTIFIER CONTROLLER: C214-C217 R203-R206 U28 U29
CONTROLLER: C218-C230 D51 D52 R207-R216 R218 U30
FEEDBACK: C231 C232 R217 R219-R224 U31 U32

### Ports
24VDC-C4 (see Top-Sheet[6B], Connector-Sheet[4D]), H_V-C4 (see Top-Sheet[5B], PFC-Sheet-ch4[1D]), HV_S-C4 (see Top-Sheet[5B], PFC-Sheet-ch4[1D]), PGND-C4 (see Top-Sheet[6B], Connector-Sheet[4D]), RVCC-C4 (see Top-Sheet[5B], PFC-Sheet-ch4[1D]), VCC-C4 (see Top-Sheet[5C], PFC-Sheet-ch4[1D])

### Nets
GND: C198.1 C207.2 C210.2 C211.1 C219.1 C220.1 C221.1 C222.1 C223.2 C224.1 C225.2 C226.1 C227.1 C228.1 C229.1 C230.1 C232.2 D50.2(A) R201.2 R202.1 R215.1 R216.1 R218.1 R219.1 T12.14 U27.3(S) U30.11(GND)
SGND-C4: C200.2 C201.2 C202.2 C203.2 C204.2 C205.2 C212.1 C213.1 C214.1 C215.1 C216.1 C217.1 NT4.1 Q26.1(S) Q26.2(S) Q26.3(S) Q28.1(S) Q28.2(S) Q28.3(S) U28.2(VS) U29.2(VS)
24VDC-C4: C198.2 C200.1 C201.1 C202.1 C203.1 C204.1 C205.1 C206.2 C212.2 C213.2 C215.2 C217.2 R222.2 T12.3 T12.4 T12.5 T12.6 U28.4(VDD) U29.4(VDD) ; port 24VDC-C4
BLK-C4: C230.2 R214.1 R218.2 U30.4(BLK)
BW-C4: C228.2 R198.1 R202.2 U30.8(BW)
FB-C4: C232.1 U30.5(FB) U32.4(C)
H_V-C4: C199.1 R211.2 U26.2(D) ; port H_V-C4
HB-C4: C218.1 D51.1(K) U30.14(HB)
HO-C4: D47.1(K) R195.1 U30.15(HO)
HS-C4: C218.2 R196.2 T12.12 U26.3(S) U27.2(D) U30.16(HS)
HV_S-C4: R207.1 ; port HV_S-C4
ISNS-C4: C208.1 C226.2 R215.2 U30.6(ISNS)
LO-C4: D49.1(K) R200.1 U30.10(LO)
PGND-C4: C206.1 NT4.2 R217.2 U31.3(ANODE) ; port PGND-C4
RVCC-C4: C219.2 C220.2 C221.2 C222.2 R210.1 R213.2 U30.12(RVCC) ; port RVCC-C4
VCC-C4: C224.2 D52.1(A) Q27.3(E) ; port VCC-C4
VCR-C4: C209.1 C227.2 U30.7(VCR)
VD_R1-C4: Q28.5(D) Q28.6(D) Q28.7(D) Q28.8(D) R203.1 T12.7 T12.8
VD_R2-C4: Q26.5(D) Q26.6(D) Q26.7(D) Q26.8(D) R204.1 T12.1 T12.2
VG_R1-C4: Q28.4(G) R205.1
VG_R2-C4: Q26.4(G) R206.1
NetC199_2: C199.2 C207.1 C208.2 C209.2 T12.10
NetC210_1: C210.1 C211.2 Q27.2(C) Q27.4(C) R197.1 R199.2
NetC214_2: C214.2 U28.3(REG)
NetC216_2: C216.2 U29.3(REG)
NetC223_1: C223.1 C225.1 D52.2(K) U30.3(VCC)
NetC229_2: C229.2 R213.1 R216.2 U30.9(LL/SS)
NetC231_1: C231.1 R223.2 U31.2(CATHODE) U32.2(Ca)
NetC231_2: C231.2 R220.1
NetD47_2: D47.2(A) R195.2 R196.1 U26.1(G)
NetD48_1: D48.1(A) R198.2 T12.15
NetD48_2: D48.2(K) R197.2
NetD49_2: D49.2(A) R200.2 R201.1 U27.1(G)
NetD50_1: D50.1(K) Q27.1(B) R199.1
NetD51_2: D51.2(A) R210.2
NetR203_2: R203.2 U28.5(VD)
NetR204_2: R204.2 U29.5(VD)
NetR205_2: R205.2 U28.1(VG)
NetR206_2: R206.2 U29.1(VG)
NetR207_2: R207.2 R208.1
NetR208_2: R208.2 R209.1
NetR209_2: R209.2 U30.1(HV)
NetR211_1: R211.1 R212.2
NetR212_1: R212.1 R214.2
NetR217_1: R217.1 R220.2 R221.1 U31.1(REF)
NetR219_2: R219.2 U32.3(E)
NetR221_2: R221.2 R222.1 R223.1 R224.2
NetR224_1: R224.1 U32.1(An)

### Notes on the sheet
- File:
- Title:
- Date:
- Page
- Num:
- Total:
- Drawn By: Huzaifa Ali
- (in symbol 760895741) N1; N2; N4; N3